# Altium schematic sheet Current_Sink.SchDoc
size A4; SheetNumber: 3; SheetTotal: 3
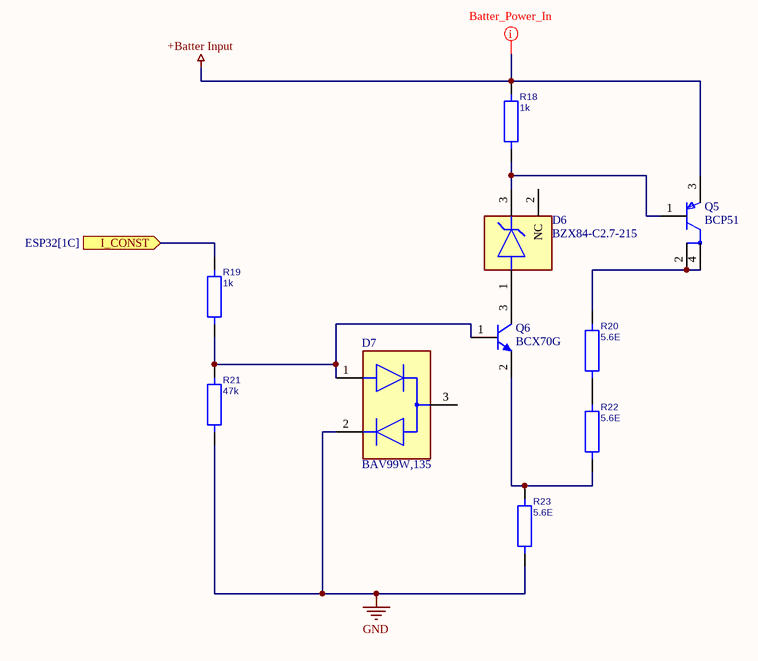
[diagram p0: Current_Sink.SchDoc]

## Parts
D6  BZX84-C2.7-215  [FP-SOT23-MFG]
D7  BAV99W,135  [FP-SOT323-IPC_B]
Q5  BCP51  [FP-318H-MFG]
Q6  BCX70G  [INF-SOT23_N]
R18  1k  [RES0805MD]
R19  1k  [RES0805MD]
R20  5.6E  [RES0805MD]
R21  47k  [RES0805MD]
R22  5.6E  [RES0805MD]
R23  5.6E  [RES0805MD]

## Ports
I_CONST (in, see ESP32[1C])

## Nets
+Batter Input: Q5.3(E) R18.2
GND: D7.2 R21.1 R23.1
I_CONST: R19.2 ; port I_CONST
NetD6_1: D6.1(A) Q6.3(C)
NetD6_3: D6.3(K) Q5.1(B) R18.1
NetD7_1: D7.1 Q6.1(B) R19.1 R21.2
NetQ5_2: Q5.2(C) Q5.4(C) R20.2
NetQ6_2: Q6.2(E) R22.1 R23.2
NetR20_1: R20.1 R22.2

Not connected (* = marked no-connect by the designer): D6 2(NC); D7 3

## Layout directives
net class Batter_Power_In: +Batter Input

## Library data of the parts
D6 = CMP-14400-000001-1: DIODE ZENER 2,7V 250MW SOT23; Manufacturer: Nexperia; Manufacturer Part Number: BZX84-C20,215; Automotive Grade: Grade 0; Zener Impedance: 15Ω; Max Junction Temp: +150°C; Max Zener Voltage: 21.2V; Nom Zener Voltage: 20V; Max Reverse Leakage Current: 0.05uA; Forward Current: 200mA; Reverse Voltage: 14V; Device Class L2: Diodes; ComponentLink2Description: Datasheet; Temperature Range Low: -65°C; Height: 1.1mm; Ipc Land Pattern Name: SOT95P230X100-3; Octopart: https://octopart.com/bzx84-c20%2C215-nexperia-78740231; ComponentLink2URL: https://assets.nexperia.com/documents/data-sheet/BZX84_SER.pdf; Footprint Url: https://assets.nexperia.com/documents/outline-drawing/SOT23.pdf; Power Dissipation: 250mW; RoHS: TRUE; Lead Free: Yes; Mouser Description: Diode Zener Single 20V 5% 250mW Automotive 3-Pin SOT-23 T/R; Automotive: Yes; Device Class L1: Discrete Semiconductors; Temperature: -65°C to +150°C; Package: SOT23; Category: Diode; Digikey Description: DIODE ZENER 20V 250MW SOT23; Ambient Temperature Range High: +150°C; Temperature Range High: +150°C; Device Class L3: Zener Diodes
D7 = CMP-14399-000011-1: DIODE ARRAY GP 100V 150MA SOT323
Q5 = CMP-00278-84324633-1: BCP51 Trans Gp Bjt PNP 45V 1.5A 1000MW 4-PIN(3+TAB) SOT-223 T/r / Trans PNP 45V 1.5A SOT-223; Manufacturer Lifecycle Status: OBSOLETE; Collector Emitter Breakdown Voltage: -45V; Collector Emitter Saturation Voltage: -500mV; Power Dissipation: 1W; Max Collector Current: -1.5A; hFE Min: 40; Number of Elements: 1; Max Junction Temperature (Tj): 150°C; Emitter Base Voltage (VEBO): -5V; Number of Pins: 3; RoHS: Compliant; Collector Base Voltage (VCBO): -45V; NexarPartId: 84324633; Polarity: PNP; Collector Emitter Voltage (VCEO): -45V; Schedule B: 8541290080, 8541290080; Lead Free: Lead Free; Lifecycle Status: Obsolete; Height: 1.8mm; Case/Package: SOT-223; Max Operating Temperature: 150°C; Min Operating Temperature: -55°C
Q6 = CMP-1177-00052-1: NPN Silicon AF Transistor, 45 V VCEO, 100 mA IC, SOT23, Reel, Green; Manufacturer: Infineon; ICM (max): 200Â mA; ICBO (max): 20Â nA; Green: TRUE; fT (typ): 250Â MHz; IC (max): 100Â mA; VCEO (max): 45Â V; Ptot (max): 330Â mW; VEBO (max): 6Â V; F (typ): 2 dB; PackageDescription: 3-Pin Small Outline Transistor Package, 1.3 x 2.9 mm Body, 0.95 mm Pitch; Packing: Reel; Polarity: NPN; ComponentLink3URL: http://www.infineon.com/dgdl/SOT23-Package_Overview.pdf?folderId=db3a30431936bc4b0119532290053c66&fileId=db3a30431936bc4b0119533468123c85; ComponentLink2Description: Datasheet; ComponentLink1URL: http://www.infineon.com/; Mounting Technology: Surface Mount; PackageReference: SOT23; ComponentLink2URL: http://www.infineon.com/dgdl/bcw60_bcx70.pdf?folderId=db3a304314dca389011541d30fa21656&fileId=db3a304314dca38901154219c9141726; ComponentLink1Description: Manufacturer URL; VCBO (max): 45Â V; ComponentLink3Description: Package Specification; PartNumber: BCX70G; IBM (max): 200Â mA; PackageVersion: Apr-08
R18-R23 = UID-0F2DF2513351442B7CD8: RES 2K2 1% 125mW 0805; SAP-Partnumber: 35110490; Manufacturer Part Number: RC0805FR-132K2L; Manufacturer: Yageo; Compliance: RoHS; Voltage - Rated: 150V; Temperature Coefficient: TC100; Temperature - Rated: -55 °C to +155 °C; Remark: NGX; Reviewer: hoersede; Library Status: New; uid: UID-0F2DF2513351442B7CD8; partid: 156; ComponentLink1Description: Datasheet; ComponentLink1URL: https://code.bbraun.io/BA-RD-EE/altium-partlib/raw/main/components/datasheets/35110490_SMD_Widerstand_2K2_1Proz_0805/Yageo_RC0805FR-132K2L.pdf; ComponentLink2Description: Compliance Certificate; ComponentLink2URL: https://code.bbraun.io/BA-RD-EE/altium-partlib/raw/main/components/datasheets/35110490_SMD_Widerstand_2K2_1Proz_0805/Yageo_RC0805FR-132K2L.pdf; ComponentLink3Description: Datasheet Folder; ComponentLink3URL: https://code.bbraun.io/BA-RD-EE/altium-partlib/raw/main/components/datasheets/35110490_SMD_Widerstand_2K2_1Proz_0805/; ComponentLink4Description: Data Sheet Library; ComponentLink4URL: http://ais.development.bbraun.com/dsl/35110490; Supplier Part Number 1: 603-RC0805FR-132K2L; Supplier Part Number 2: 13-RC0805FR-132K2LTR-ND; Supplier 1: Mouser; Supplier 2: Digikey; Supplier 3: RS Components; Supplier 4: Farnell; Value: 2k2; Tolerance: 1%; Maximum Height: 0.6 mm; Package / Case: 0805; Technology: SMT; Type: Thick Film; Price@1k: 0,0075 €; Power - Rated: 125mW; Creator: GEG DF,GK; Creation Date: 22.04.2022; Last Updated: 22.06.2023; Review Date: 10.03.2026; Lifecycle Status: Active